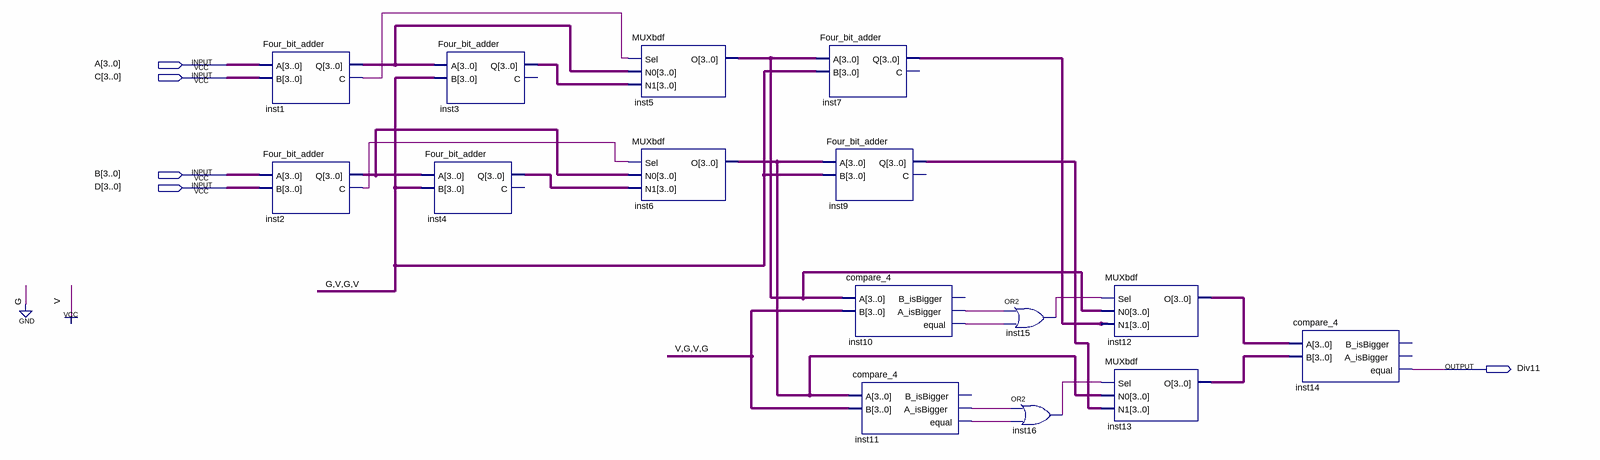
[diagram p0: schematic sheet]
// Quartus schematic Div11.bdf as structural Verilog: 15 symbols, 5 pins
module Div11 (
  input  [3:0] A,
  input  [3:0] C,
  input  [3:0] B,
  input  [3:0] D,
  output Div11
);

  wire inst1_c, inst2_c, inst10_a_isbigger, inst10_equal, inst11_a_isbigger, inst11_equal, inst15_out,
       inst16_out;
  wire [3:0] inst1_q, inst2_q, inst3_q, inst4_q, inst5_o, inst6_o, inst7_q, inst9_q, inst12_o, inst13_o;

  Four_bit_adder inst1 (.A(A), .B(C), .Q(inst1_q), .C(inst1_c));
  Four_bit_adder inst2 (.A(B), .B(D), .Q(inst2_q), .C(inst2_c));
  Four_bit_adder inst3 (.A(inst1_q), .B(4'b0101), .Q(inst3_q));  // open: C
  Four_bit_adder inst4 (.A(inst2_q), .B(4'b0101), .Q(inst4_q));  // open: C
  MUXbdf inst5 (.Sel(inst1_c), .N0(inst1_q), .N1(inst3_q), .O(inst5_o));
  MUXbdf inst6 (.Sel(inst2_c), .N0(inst2_q), .N1(inst4_q), .O(inst6_o));
  Four_bit_adder inst7 (.A(inst5_o), .B(4'b0101), .Q(inst7_q));  // open: C
  Four_bit_adder inst9 (.A(inst6_o), .B(4'b0101), .Q(inst9_q));  // open: C
  compare_4 inst10 (
    .A(inst5_o), .B(4'b1010), .A_isBigger(inst10_a_isbigger), .equal(inst10_equal));  // open: B_isBigger
  compare_4 inst11 (
    .A(inst6_o), .B(4'b1010), .A_isBigger(inst11_a_isbigger), .equal(inst11_equal));  // open: B_isBigger
  or inst15 (inst15_out, inst10_a_isbigger, inst10_equal);
  or inst16 (inst16_out, inst11_a_isbigger, inst11_equal);
  MUXbdf inst12 (.Sel(inst15_out), .N0(inst5_o), .N1(inst7_q), .O(inst12_o));
  MUXbdf inst13 (.Sel(inst16_out), .N0(inst6_o), .N1(inst9_q), .O(inst13_o));
  compare_4 inst14 (.A(inst12_o), .B(inst13_o), .equal(Div11));  // open: B_isBigger, A_isBigger
endmodule
